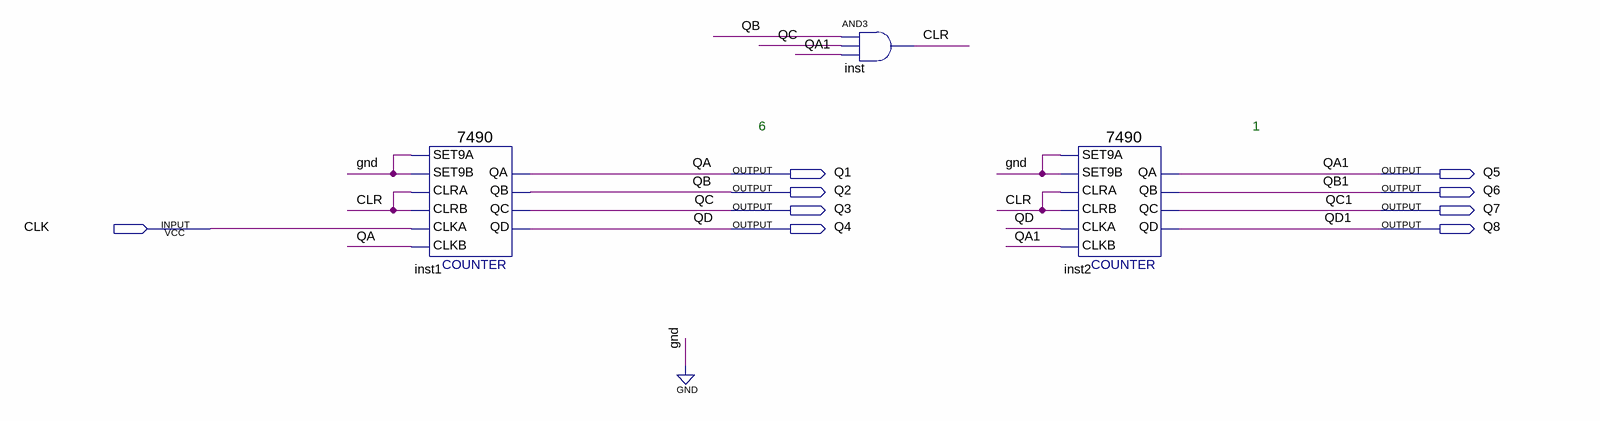
[diagram p0: schematic sheet]
// Quartus schematic FPGA_Mod16.bdf as structural Verilog: 3 symbols, 9 pins
module FPGA_Mod16 (
  input  CLK,
  output Q1,
  output Q5,
  output Q2,
  output Q6,
  output Q3,
  output Q7,
  output Q4,
  output Q8
);

  wire CLR;

  \7490  inst1 (
    .SET9A(1'b0), .CLRA(CLR), .SET9B(1'b0), .CLKB(Q1), .CLKA(CLK), .CLRB(CLR), .QD(Q4), .QA(Q1), .QB(Q2),
    .QC(Q3));
  and inst (CLR, Q2, Q3, Q5);
  \7490  inst2 (
    .SET9A(1'b0), .CLRA(CLR), .SET9B(1'b0), .CLKB(Q5), .CLKA(Q4), .CLRB(CLR), .QD(Q8), .QA(Q5), .QB(Q6),
    .QC(Q7));

  // Other names for the same wires on the sheet: QA = Q1; QA1 = Q5; QB = Q2; QB1 = Q6; QC = Q3; QC1 = Q7; QD = Q4;
  //   QD1 = Q8

  // Notes on the sheet:
  //   6
  //   1
endmodule
